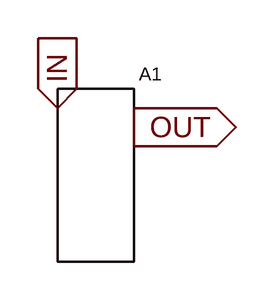
[diagram p0: schematic adevice_block.asc]
adevice_block.asc, the LTspice schematic file:
Version 4
SHEET 1 880 680
FLAG 64 64 IN
IOPIN 64 64 In
FLAG 128 80 OUT
IOPIN 128 80 Out
SYMBOL a8 96 64 R0
SYMATTR InstName A1

The netlist it stands for:
* adevice_block.asc
A1 IN 0 0 0 0 0 OUT 0 AND
.backanno
.end